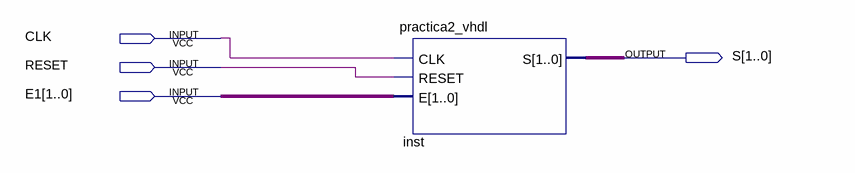
[diagram p0: schematic sheet]
// Quartus schematic practica2.bdf as structural Verilog: 1 symbols, 4 pins
module practica2 (
  input  CLK,
  input  RESET,
  input  [1:0] E1,
  output [1:0] S
);

  practica2_vhdl inst (.CLK(CLK), .RESET(RESET), .E(E1), .S(S));
endmodule
